# Altium project Project Nixie (Baseboard).PrjPcb
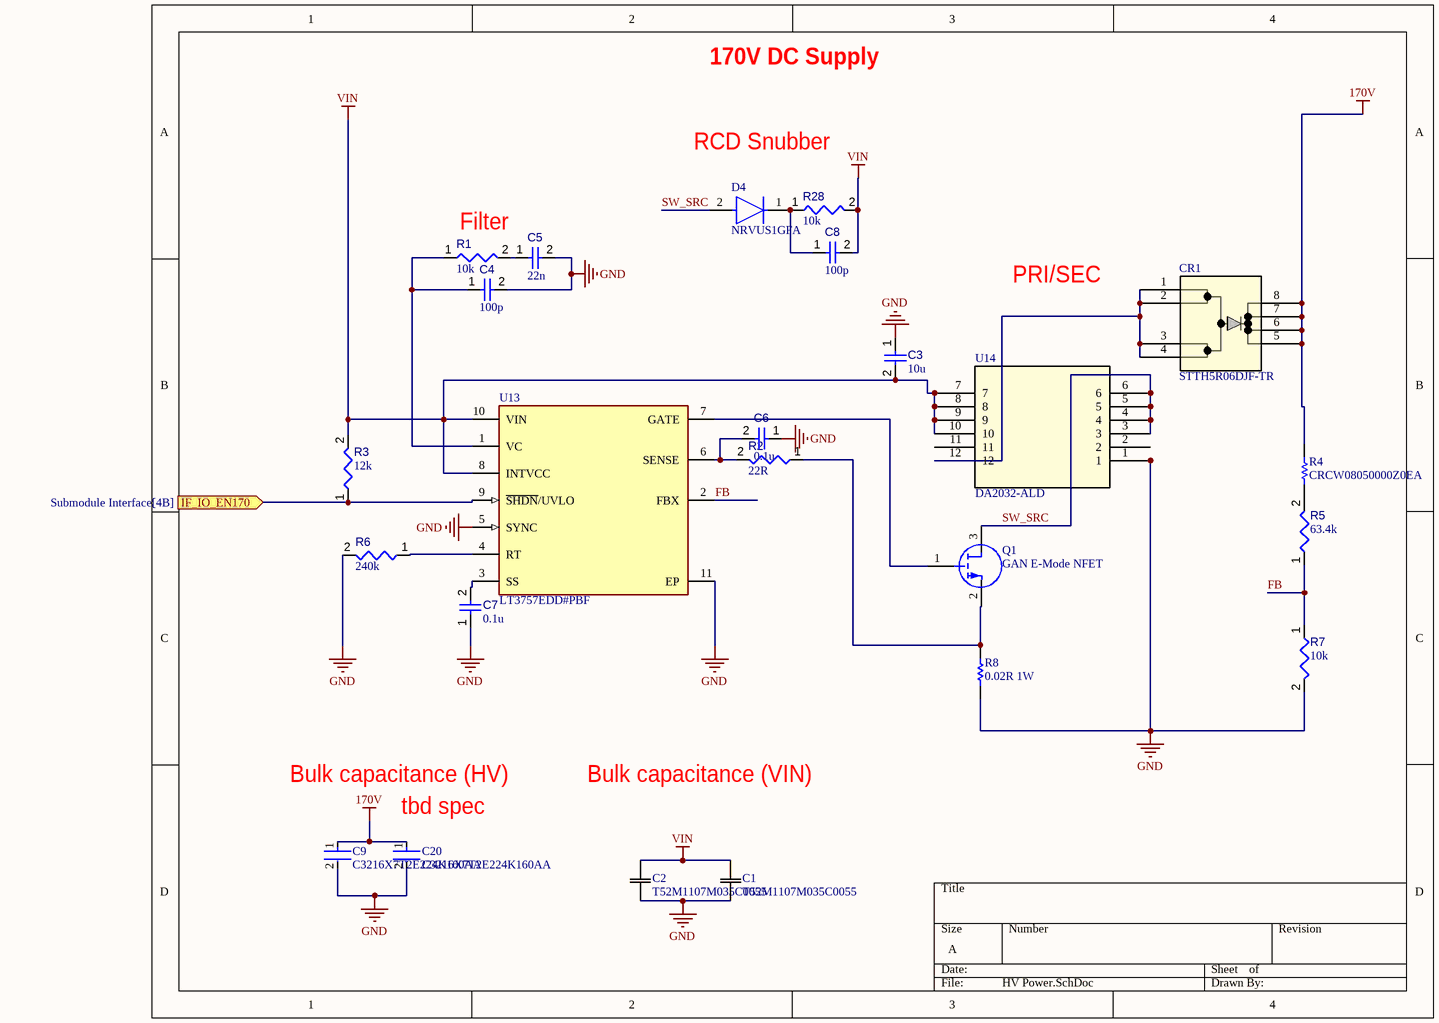
[diagram p0: HV Power.SchDoc]
5 sheets, 91 parts. Net scope: flat (ports and power ports of the same name join across sheets).
Board file: PCB1.PcbDoc
Sheets:
  HV Power.SchDoc
  Drivers.SchDoc
  USB PD.SchDoc
  Digital Supply.SchDoc
  ARGB LEDs.SchDoc

## Sheet HV Power.SchDoc
size A; SheetNumber: 1; SheetTotal: 6

### Parts
C1  T52M1107M035C0055  [CAP_35C0055_VIS]
C2  T52M1107M035C0055  [CAP_35C0055_VIS]
C3  value 10u  [CAPC0402(1005)60_L]  (hidden comment: Capacitor 10µF +/-40% 6.3V 0402)
C4  value 100p  [CAPC0402(1005)60_L]  (hidden comment: Capacitor 10µF +/-40% 6.3V 0402)
C5  value 22n  [CAPC0402(1005)60_L]  (hidden comment: Capacitor 10µF +/-40% 6.3V 0402)
C6  value 0.1u  [CAPC0402(1005)60_L]  (hidden comment: Capacitor 10µF +/-40% 6.3V 0402)
C7  value 0.1u  [CAPC0402(1005)60_L]  (hidden comment: Capacitor 10µF +/-40% 6.3V 0402)
C8  value 100p  [CAPC0402(1005)60_L]  (hidden comment: Capacitor 10µF +/-40% 6.3V 0402)
C9  C3216X7T2E224K160AA  [FP-C3216-160-0_2-IPC_C]
C20  C3216X7T2E224K160AA  [FP-C3216-160-0_2-IPC_C]
CR1  STTH5R06DJF-TR  [POWERFLAT5X6_STM]
D4  NRVUS1GFA  [FP-425AB-MFG]
Q1  GAN E-Mode NFET  [PCBComponent_1]
R1  value 10k  [RESC1005X40X25ML05T05]  (hidden comment: Resistor 10k +/-1% 0402 63 mW)
R2  value 22R  [RESC1005X40X25ML05T05]  (hidden comment: Resistor 10k +/-1% 0402 63 mW)
R3  value 12k  [RESC1005X40X25ML05T05]  (hidden comment: Resistor 10k +/-1% 0402 63 mW)
R4  CRCW08050000Z0EA  [RESC2013X50X30LL20T20]
R5  value 63.4k  [RESC1005X40X25ML05T05]  (hidden comment: Resistor 10k +/-1% 0402 63 mW)
R6  value 240k  [RESC1005X40X25ML05T05]  (hidden comment: Resistor 10k +/-1% 0402 63 mW)
R7  value 10k  [RESC1005X40X25ML05T05]  (hidden comment: Resistor 10k +/-1% 0402 63 mW)
R8  0.02R 1W  [RESC3225X70X50NL20T20]
R28  value 10k  [RESC1005X40X25ML05T05]  (hidden comment: Resistor 10k +/-1% 0402 63 mW)
U13  LT3757EDD#PBF  [FP-DD-10-05-08-1699-IPC_A]
U14  DA2032-ALD  [SOIC12_LT3750_DA2032_14P98X17P2_COC]

### Ports
IF_IO_EN170 (in, see Submodule Interface[4B])

### Nets
170V: C9.1 C20.1 CR1.5 CR1.6 CR1.7 CR1.8 R4.2
GND: C1.1 C2.1 C3.1 C4.2 C5.2 C6.1 C7.1 C9.2 C20.2 R6.2 R7.2 R8.1 U13.5(SYNC) U13.11(EP) U14.1
VIN: C1.2 C2.2 C3.2 C8.2 R3.2 R28.2 U13.8(INTVCC) U13.10(VIN) U14.7 U14.8 U14.9 U14.10
FB: R5.1 R7.1 U13.2(FBX)
SW_SRC: D4.2(A) Q1.3(D) U14.3 U14.4 U14.5 U14.6
NetC4_1: C4.1 R1.1 U13.1(VC)
NetC5_1: C5.1 R1.2
NetC6_2: C6.2 R2.2 U13.6(SENSE)
NetC7_2: C7.2 U13.3(SS)
NetC8_1: C8.1 D4.1(C) R28.1
NetCR1_1: CR1.1 CR1.2 CR1.3 CR1.4 U14.12
NetQ1_1: Q1.1(G) U13.7(GATE)
NetQ1_2: Q1.2(S) R2.1 R8.2
NetR3_1: R3.1 U13.9(~{SHDN}/UVLO) ; port IF_IO_EN170
NetR4_1: R4.1 R5.2
NetR6_1: R6.1 U13.4(RT)

Not connected (* = marked no-connect by the designer): U14 2 11

### Notes on the sheet
- 170V DC Supply
- RCD Snubber
- Filter
- PRI/SEC
- Bulk capacitance (HV)
- (near C20) tbd spec
- Bulk capacitance (VIN)

### Library data of the parts
C1 C2 = T52M1107M035C0055: No Description Available; Mfr_Name: Vishay
C3-C8 = CMP-001-00074-3: Chip Capacitor, 0.1µF +/-40%, 6.3V, 0402, Thickness 0.6 mm; Tolerance: 10%; Case/Package: 0402; Pins: 2; Mounting Technology: SMT; Voltage Rating: 6.3V; Max Operating Temperature: 85°C; Min Operating Temperature: -55°C
C9 C20 = CMP-08246-005598-1: Multilayer Ceramic Capacitors 220nF ±10% 250V X7T SMD 1206; Lead Free: Lead Free; Package Quantity: 1; Capacitance: 220nF; REACH SVHC: No SVHC; Min Operating Temperature: -55°C; Length: 0.126inch; Width: 0.063inch; Mount: Surface Mount; Case Code (Metric): 3216; Voltage Rating: 250V; Tolerance: 10%; Case Code (Imperial): 1206; Depth: 1.6mm; Series: C; Thickness: 0.075inch; RoHS Compliant: Yes; Voltage Rating (DC): 250V; Packaging: Tape and Reel; Max Operating Temperature: 125°C; Dielectric: X7T; Case/Package: 1206
CR1 = STTH5R06DJF-TR: No Description Available; Mfr_Name: STMicroelectronics; RefDes: RefDes; Type: Type
D4 = CMP-00278-106758013-1: NRVUS1GFA Rectifier Diode, 1 Phase, 1 Element, 1A, 400V V(RRM), Silicon; Manufacturer Lifecycle Status: ACTIVE, NOT REC; NexarPartId: 106758013; Lifecycle Status: NRND
Q1 = Component_1
R1-R3 R5-R7 R28 = CMP-009-00019-5: Chip Resistor, 12 KOhm, +/- 1%, 63 mW, -55 to 155 degC, 0402 (1005 Metric); Power: 63mW; Voltage Rating: 50V; Case/Package: 0402; Mounting Technology: SM; Pins: 2; Min Operating Temperature: -55°C; Tolerance: 1%; RoHS Compliant: True; Max Operating Temperature: 155°C
R4 = CMP-2001-04896-1: Manufacturer: Vishay Dale; Part Number: CRCW08050000Z0EA
R8 = CMP-2005-03839-2: Part Number: ERJ-L14KF20MU; Manufacturer: Panasonic
U13 = CMP-09139-000444-1: IC REG CTRLR MULT TOPOLOGY 10DFN; Max Input Voltage: 40V; Number of Output Phases: 1; Min Supply Voltage: 2.9V; Switching Frequency: 1MHz; Min Output Voltage: 1.569V; Max Output Voltage: 350V; Clock Sync: Yes; Output Current: 25A; Topology: Boost; Max Output Current: 12uA; Synchronous Rectifier: No; Height: 0.7mm; Number of Outputs: 1; Packaging: Rail/Tube; Max Supply Voltage: 40V; Min Operating Temperature: -40°C; Output Voltage: 350V; RoHS Compliant: Yes; Mount: Surface Mount; Number of Pins: 10; REACH SVHC: No SVHC; Width: 3mm; Case/Package: DFN; Min Input Voltage: 2.9V; Package Quantity: 121; Length: 3mm; Max Operating Temperature: 125°C
U14 = DA2032-ALD: No Description Available; Mfr_Name: Coilcraft; RefDes: RefDes; Type: Type

## Sheet Drivers.SchDoc
size D; SheetNumber: 2; SheetTotal: 6
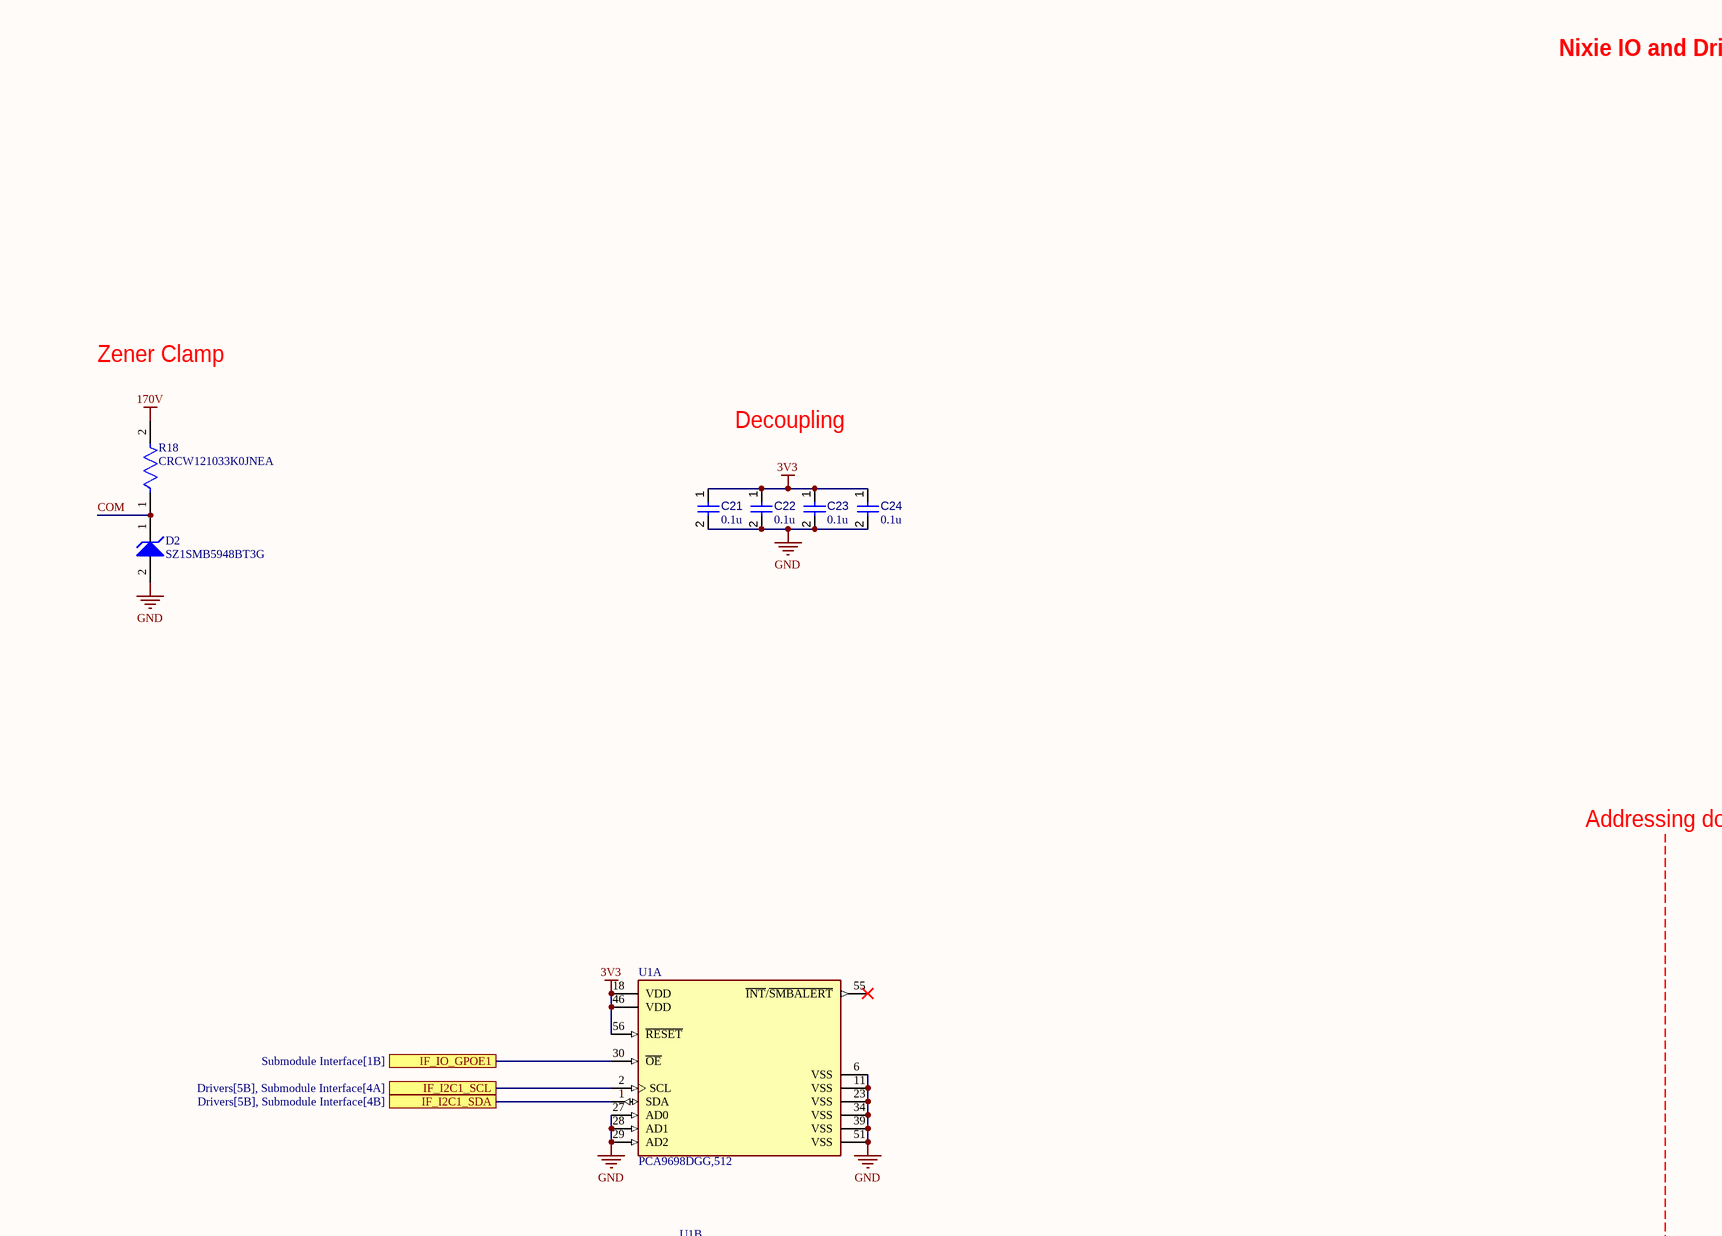
[diagram p1: Drivers.SchDoc, top left]
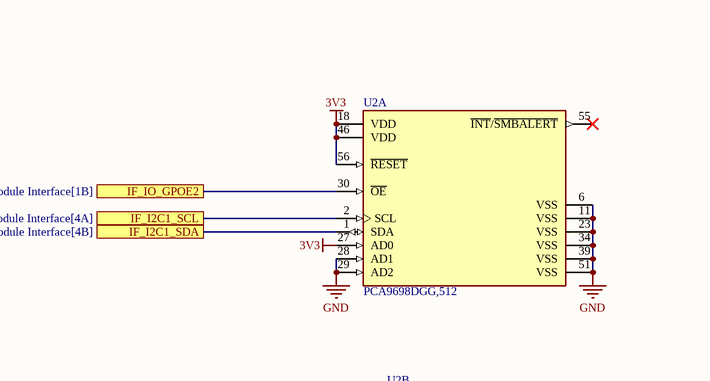
[diagram p2: Drivers.SchDoc, top right]
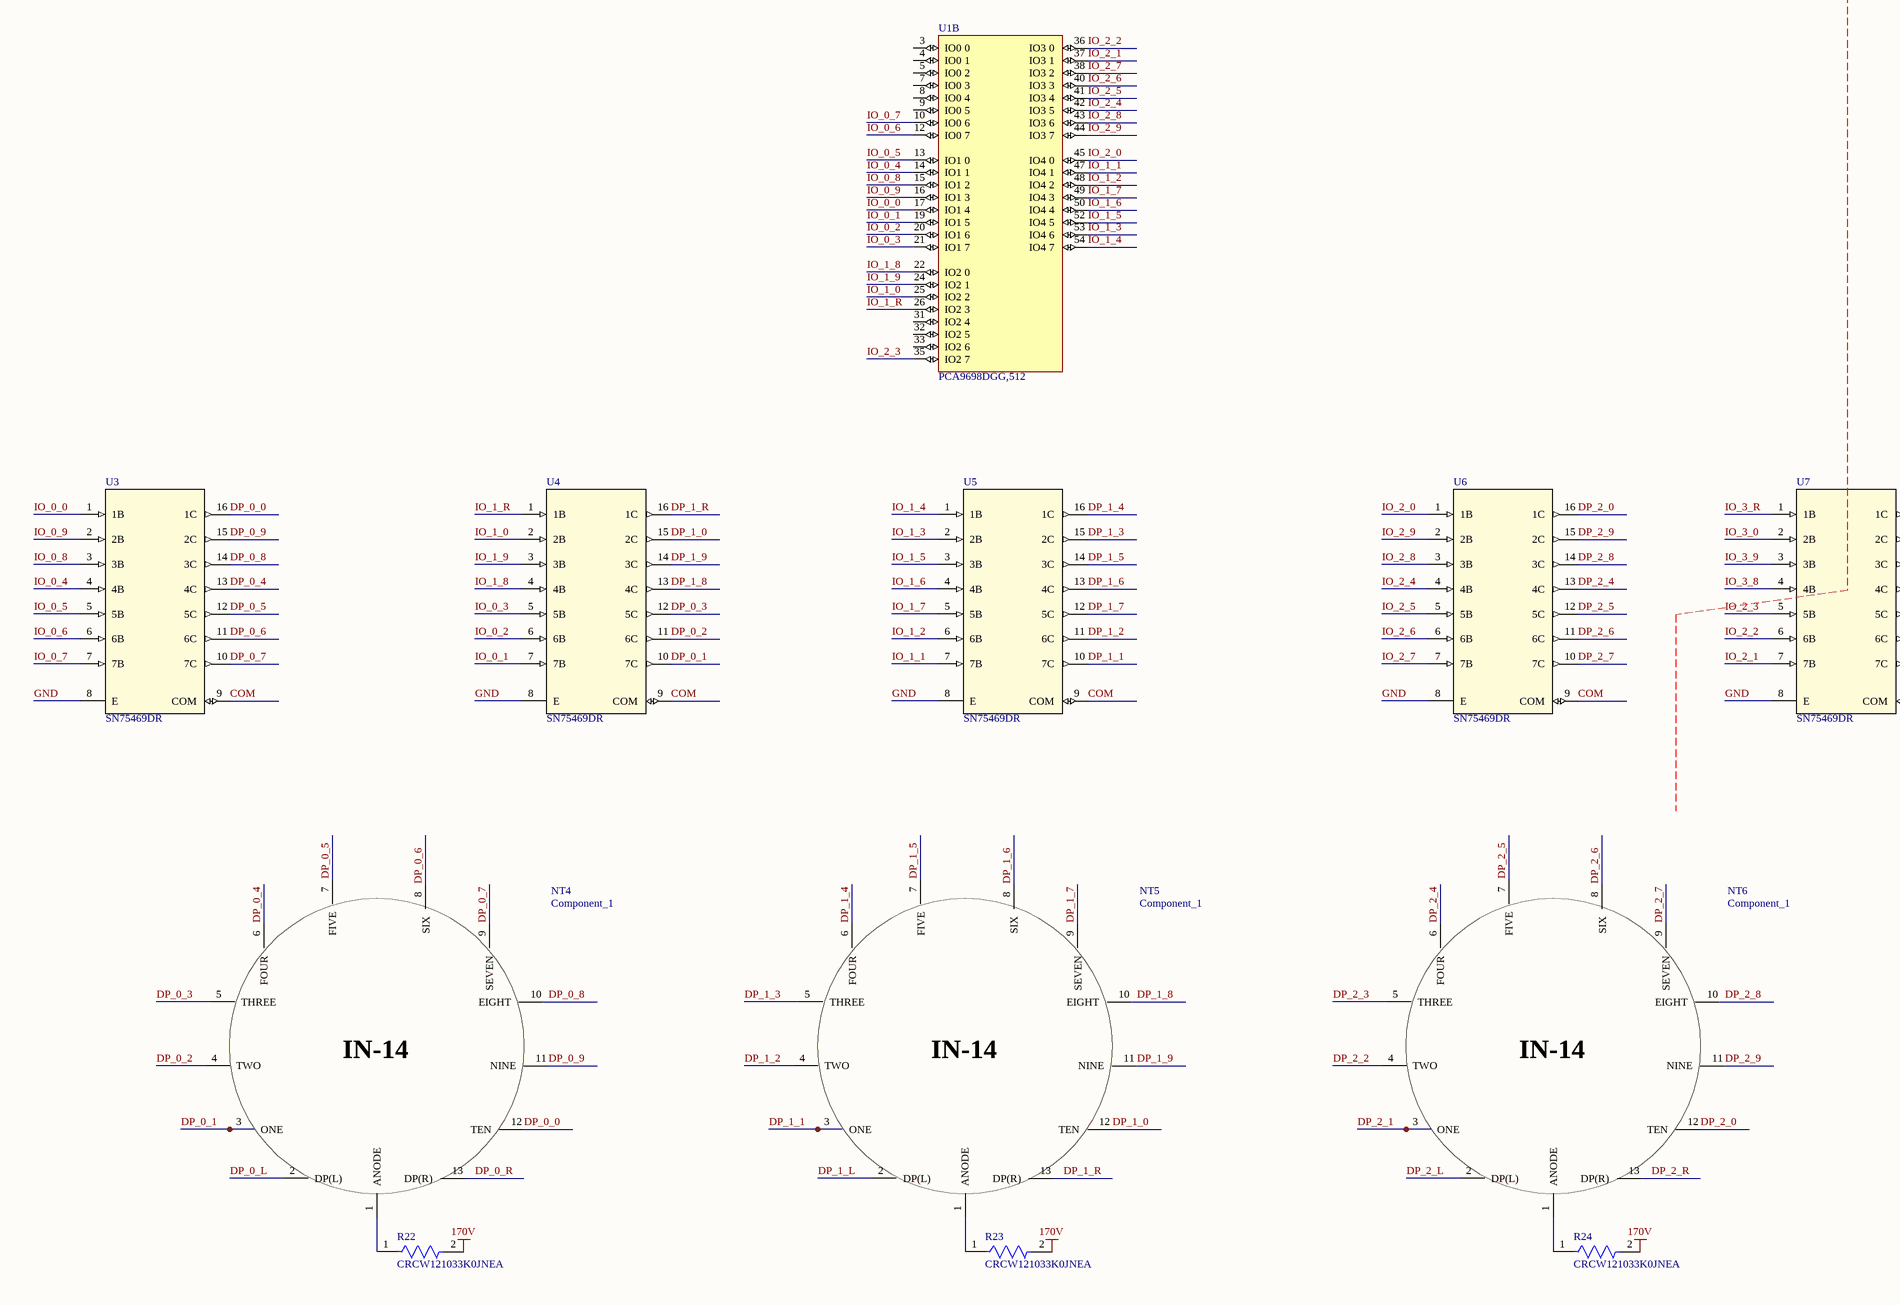
[diagram p3: Drivers.SchDoc, bottom left]
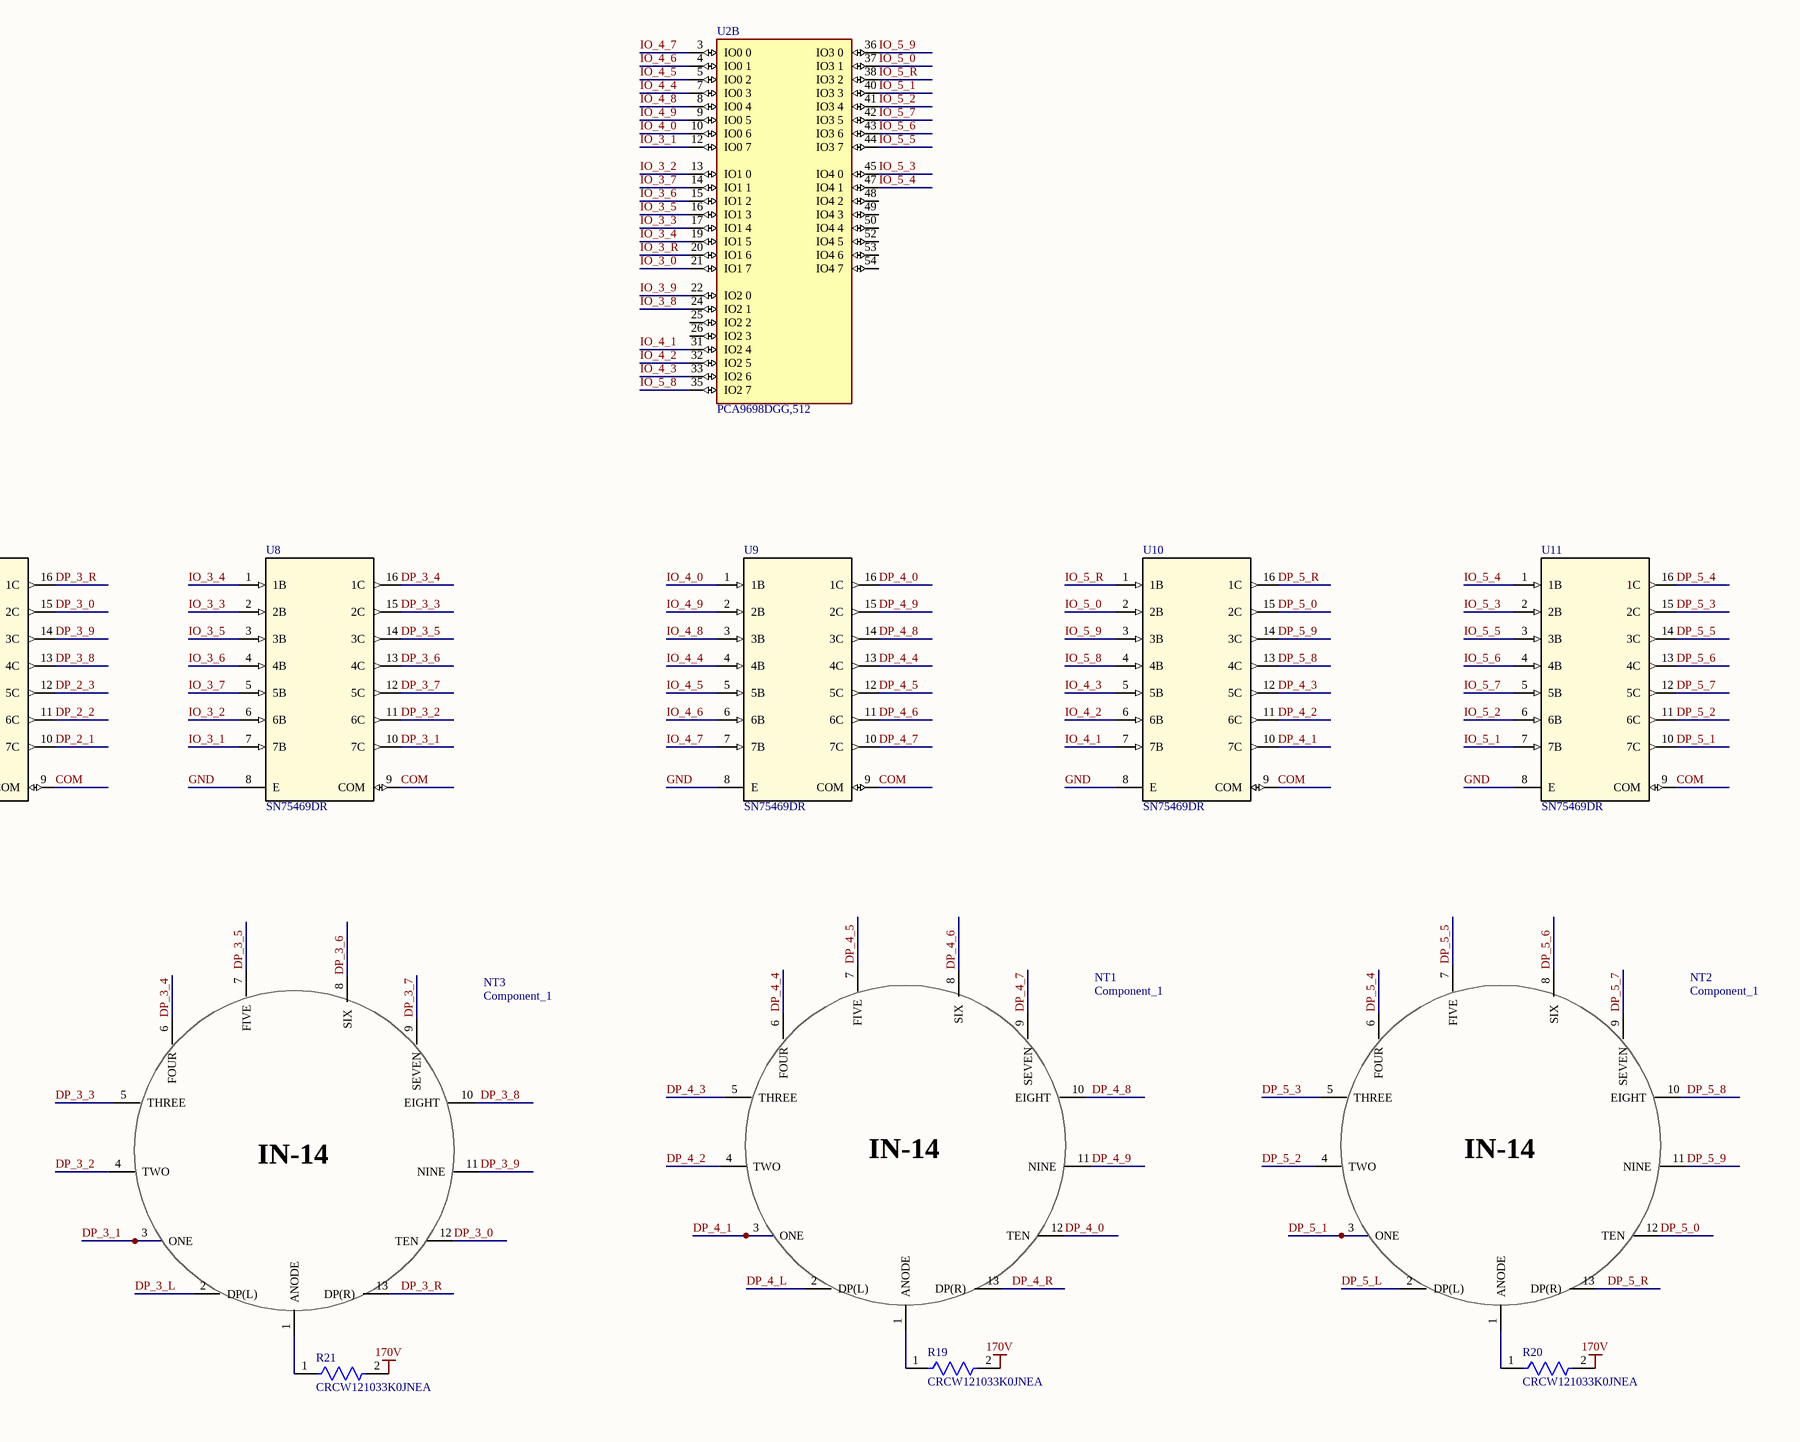
[diagram p4: Drivers.SchDoc, bottom right]

### Parts
C21  value 0.1u  [CAPC0402(1005)60_L]  (hidden comment: Capacitor 10µF +/-40% 6.3V 0402)
C22  value 0.1u  [CAPC0402(1005)60_L]  (hidden comment: Capacitor 10µF +/-40% 6.3V 0402)
C23  value 0.1u  [CAPC0402(1005)60_L]  (hidden comment: Capacitor 10µF +/-40% 6.3V 0402)
C24  value 0.1u  [CAPC0402(1005)60_L]  (hidden comment: Capacitor 10µF +/-40% 6.3V 0402)
D2  SZ1SMB5948BT3G  [ONSC-SMB-2-403A-03_H_V]
NT1  Component_1  [PCBComponent_1]
NT2  Component_1  [PCBComponent_1]
NT3  Component_1  [PCBComponent_1]
NT4  Component_1  [PCBComponent_1]
NT5  Component_1  [PCBComponent_1]
NT6  Component_1  [PCBComponent_1]
R18  CRCW121033K0JNEA  [FP-CRCW1210-e3-IPC_A]
R19  CRCW121033K0JNEA  [FP-CRCW1210-e3-IPC_A]
R20  CRCW121033K0JNEA  [FP-CRCW1210-e3-IPC_A]
R21  CRCW121033K0JNEA  [FP-CRCW1210-e3-IPC_A]
R22  CRCW121033K0JNEA  [FP-CRCW1210-e3-IPC_A]
R23  CRCW121033K0JNEA  [FP-CRCW1210-e3-IPC_A]
R24  CRCW121033K0JNEA  [FP-CRCW1210-e3-IPC_A]
U1  PCA9698DGG,512  [FP-SOT364-1-MFG]  (parts A,B of 2)
U2  PCA9698DGG,512  [FP-SOT364-1-MFG]  (parts A,B of 2)
U3  SN75469DR  [D0016A_N]
U4  SN75469DR  [D0016A_N]
U5  SN75469DR  [D0016A_N]
U6  SN75469DR  [D0016A_N]
U7  SN75469DR  [D0016A_N]
U8  SN75469DR  [D0016A_N]
U9  SN75469DR  [D0016A_N]
U10  SN75469DR  [D0016A_N]
U11  SN75469DR  [D0016A_N]

### Ports
IF_I2C1_SCL (see Drivers[2B], Submodule Interface[4A]), IF_I2C1_SCL (see Drivers[5B], Submodule Interface[4A]), IF_I2C1_SDA (see Drivers[2B], Submodule Interface[4B]), IF_I2C1_SDA (see Drivers[5B], Submodule Interface[4B]), IF_IO_GPOE1 (see Submodule Interface[1B]), IF_IO_GPOE2 (see Submodule Interface[1B])

### Nets
3V3: C21.1 C22.1 C23.1 C24.1 U1.18(VDD) U1.46(VDD) U1.56(~{RESET}) U2.18(VDD) U2.27(AD0) U2.46(VDD) U2.56(~{RESET})
170V: R18.2 R19.2 R20.2 R21.2 R22.2 R23.2 R24.2
GND: C21.2 C22.2 C23.2 C24.2 D2.2(A) U1.6(VSS) U1.11(VSS) U1.23(VSS) U1.27(AD0) U1.28(AD1) U1.29(AD2) U1.34(VSS) U1.39(VSS) U1.51(VSS) U2.6(VSS) U2.11(VSS) U2.23(VSS) U2.28(AD1) U2.29(AD2) U2.34(VSS) U2.39(VSS) U2.51(VSS) U3.8(E) U4.8(E) U5.8(E) U6.8(E) U7.8(E) U8.8(E) U9.8(E) U10.8(E) U11.8(E)
COM: D2.1(K) R18.1 U3.9(COM) U4.9(COM) U5.9(COM) U6.9(COM) U7.9(COM) U8.9(COM) U9.9(COM) U10.9(COM) U11.9(COM)
DP_0_0: NT4.12(TEN) U3.16(1C)
DP_0_1: NT4.3(ONE) U4.10(7C)
DP_0_2: NT4.4(TWO) U4.11(6C)
DP_0_3: NT4.5(THREE) U4.12(5C)
DP_0_4: NT4.6(FOUR) U3.13(4C)
DP_0_5: NT4.7(FIVE) U3.12(5C)
DP_0_6: NT4.8(SIX) U3.11(6C)
DP_0_7: NT4.9(SEVEN) U3.10(7C)
DP_0_8: NT4.10(EIGHT) U3.14(3C)
DP_0_9: NT4.11(NINE) U3.15(2C)
DP_0_L: NT4.2(DP(L))
DP_0_R: NT4.13(DP(R))
DP_1_0: NT5.12(TEN) U4.15(2C)
DP_1_1: NT5.3(ONE) U5.10(7C)
DP_1_2: NT5.4(TWO) U5.11(6C)
DP_1_3: NT5.5(THREE) U5.15(2C)
DP_1_4: NT5.6(FOUR) U5.16(1C)
DP_1_5: NT5.7(FIVE) U5.14(3C)
DP_1_6: NT5.8(SIX) U5.13(4C)
DP_1_7: NT5.9(SEVEN) U5.12(5C)
DP_1_8: NT5.10(EIGHT) U4.13(4C)
DP_1_9: NT5.11(NINE) U4.14(3C)
DP_1_L: NT5.2(DP(L))
DP_1_R: NT5.13(DP(R)) U4.16(1C)
DP_2_0: NT6.12(TEN) U6.16(1C)
DP_2_1: NT6.3(ONE) U7.10(7C)
DP_2_2: NT6.4(TWO) U7.11(6C)
DP_2_3: NT6.5(THREE) U7.12(5C)
DP_2_4: NT6.6(FOUR) U6.13(4C)
DP_2_5: NT6.7(FIVE) U6.12(5C)
DP_2_6: NT6.8(SIX) U6.11(6C)
DP_2_7: NT6.9(SEVEN) U6.10(7C)
DP_2_8: NT6.10(EIGHT) U6.14(3C)
DP_2_9: NT6.11(NINE) U6.15(2C)
DP_2_L: NT6.2(DP(L))
DP_2_R: NT6.13(DP(R))
DP_3_0: NT3.12(TEN) U7.15(2C)
DP_3_1: NT3.3(ONE) U8.10(7C)
DP_3_2: NT3.4(TWO) U8.11(6C)
DP_3_3: NT3.5(THREE) U8.15(2C)
DP_3_4: NT3.6(FOUR) U8.16(1C)
DP_3_5: NT3.7(FIVE) U8.14(3C)
DP_3_6: NT3.8(SIX) U8.13(4C)
DP_3_7: NT3.9(SEVEN) U8.12(5C)
DP_3_8: NT3.10(EIGHT) U7.13(4C)
DP_3_9: NT3.11(NINE) U7.14(3C)
DP_3_L: NT3.2(DP(L))
DP_3_R: NT3.13(DP(R)) U7.16(1C)
DP_4_0: NT1.12(TEN) U9.16(1C)
DP_4_1: NT1.3(ONE) U10.10(7C)
DP_4_2: NT1.4(TWO) U10.11(6C)
DP_4_3: NT1.5(THREE) U10.12(5C)
DP_4_4: NT1.6(FOUR) U9.13(4C)
DP_4_5: NT1.7(FIVE) U9.12(5C)
DP_4_6: NT1.8(SIX) U9.11(6C)
DP_4_7: NT1.9(SEVEN) U9.10(7C)
DP_4_8: NT1.10(EIGHT) U9.14(3C)
DP_4_9: NT1.11(NINE) U9.15(2C)
DP_4_L: NT1.2(DP(L))
DP_4_R: NT1.13(DP(R))
DP_5_0: NT2.12(TEN) U10.15(2C)
DP_5_1: NT2.3(ONE) U11.10(7C)
DP_5_2: NT2.4(TWO) U11.11(6C)
DP_5_3: NT2.5(THREE) U11.15(2C)
DP_5_4: NT2.6(FOUR) U11.16(1C)
DP_5_5: NT2.7(FIVE) U11.14(3C)
DP_5_6: NT2.8(SIX) U11.13(4C)
DP_5_7: NT2.9(SEVEN) U11.12(5C)
DP_5_8: NT2.10(EIGHT) U10.13(4C)
DP_5_9: NT2.11(NINE) U10.14(3C)
DP_5_L: NT2.2(DP(L))
DP_5_R: NT2.13(DP(R)) U10.16(1C)
IO_0_0: U1.17(IO1_4) U3.1(1B)
IO_0_1: U1.19(IO1_5) U4.7(7B)
IO_0_2: U1.20(IO1_6) U4.6(6B)
IO_0_3: U1.21(IO1_7) U4.5(5B)
IO_0_4: U1.14(IO1_1) U3.4(4B)
IO_0_5: U1.13(IO1_0) U3.5(5B)
IO_0_6: U1.12(IO0_7) U3.6(6B)
IO_0_7: U1.10(IO0_6) U3.7(7B)
IO_0_8: U1.15(IO1_2) U3.3(3B)
IO_0_9: U1.16(IO1_3) U3.2(2B)
IO_1_0: U1.25(IO2_2) U4.2(2B)
IO_1_1: U1.47(IO4_1) U5.7(7B)
IO_1_2: U1.48(IO4_2) U5.6(6B)
IO_1_3: U1.53(IO4_6) U5.2(2B)
IO_1_4: U1.54(IO4_7) U5.1(1B)
IO_1_5: U1.52(IO4_5) U5.3(3B)
IO_1_6: U1.50(IO4_4) U5.4(4B)
IO_1_7: U1.49(IO4_3) U5.5(5B)
IO_1_8: U1.22(IO2_0) U4.4(4B)
IO_1_9: U1.24(IO2_1) U4.3(3B)
IO_1_R: U1.26(IO2_3) U4.1(1B)
IO_2_0: U1.45(IO4_0) U6.1(1B)
IO_2_1: U1.37(IO3_1) U7.7(7B)
IO_2_2: U1.36(IO3_0) U7.6(6B)
IO_2_3: U1.35(IO2_7) U7.5(5B)
IO_2_4: U1.42(IO3_5) U6.4(4B)
IO_2_5: U1.41(IO3_4) U6.5(5B)
IO_2_6: U1.40(IO3_3) U6.6(6B)
IO_2_7: U1.38(IO3_2) U6.7(7B)
IO_2_8: U1.43(IO3_6) U6.3(3B)
IO_2_9: U1.44(IO3_7) U6.2(2B)
IO_3_0: U2.21(IO1_7) U7.2(2B)
IO_3_1: U2.12(IO0_7) U8.7(7B)
IO_3_2: U2.13(IO1_0) U8.6(6B)
IO_3_3: U2.17(IO1_4) U8.2(2B)
IO_3_4: U2.19(IO1_5) U8.1(1B)
IO_3_5: U2.16(IO1_3) U8.3(3B)
IO_3_6: U2.15(IO1_2) U8.4(4B)
IO_3_7: U2.14(IO1_1) U8.5(5B)
IO_3_8: U2.24(IO2_1) U7.4(4B)
IO_3_9: U2.22(IO2_0) U7.3(3B)
IO_3_R: U2.20(IO1_6) U7.1(1B)
IO_4_0: U2.10(IO0_6) U9.1(1B)
IO_4_1: U2.31(IO2_4) U10.7(7B)
IO_4_2: U2.32(IO2_5) U10.6(6B)
IO_4_3: U2.33(IO2_6) U10.5(5B)
IO_4_4: U2.7(IO0_3) U9.4(4B)
IO_4_5: U2.5(IO0_2) U9.5(5B)
IO_4_6: U2.4(IO0_1) U9.6(6B)
IO_4_7: U2.3(IO0_0) U9.7(7B)
IO_4_8: U2.8(IO0_4) U9.3(3B)
IO_4_9: U2.9(IO0_5) U9.2(2B)
IO_5_0: U2.37(IO3_1) U10.2(2B)
IO_5_1: U2.40(IO3_3) U11.7(7B)
IO_5_2: U2.41(IO3_4) U11.6(6B)
IO_5_3: U2.45(IO4_0) U11.2(2B)
IO_5_4: U2.47(IO4_1) U11.1(1B)
IO_5_5: U2.44(IO3_7) U11.3(3B)
IO_5_6: U2.43(IO3_6) U11.4(4B)
IO_5_7: U2.42(IO3_5) U11.5(5B)
IO_5_8: U2.35(IO2_7) U10.4(4B)
IO_5_9: U2.36(IO3_0) U10.3(3B)
IO_5_R: U2.38(IO3_2) U10.1(1B)
NetNT1_1: NT1.1(ANODE) R19.1
NetNT2_1: NT2.1(ANODE) R20.1
NetNT3_1: NT3.1(ANODE) R21.1
NetNT4_1: NT4.1(ANODE) R22.1
NetNT5_1: NT5.1(ANODE) R23.1
NetNT6_1: NT6.1(ANODE) R24.1
NetU1_1: U1.1(SDA) U2.1(SDA) ; port IF_I2C1_SDA
NetU1_2: U1.2(SCL) U2.2(SCL) ; port IF_I2C1_SCL
NetU1_30: U1.30(~{OE}) ; port IF_IO_GPOE1
NetU2_30: U2.30(~{OE}) ; port IF_IO_GPOE2

Not connected (* = marked no-connect by the designer): U1 3(IO0_0) 4(IO0_1) 5(IO0_2) 7(IO0_3) 8(IO0_4) 9(IO0_5) 31(IO2_4) 32(IO2_5) 33(IO2_6) 55(~{INT}/~{SMBALERT})*; U2 25(IO2_2) 26(IO2_3) 48(IO4_2) 49(IO4_3) 50(IO4_4) 52(IO4_5) 53(IO4_6) 54(IO4_7) 55(~{INT}/~{SMBALERT})*

### Notes on the sheet
- Nixie IO and Drivers
- Zener Clamp
- Decoupling
- Addressing domain
- (in symbol Component_1) IN-14

### Library data of the parts
C21-C24 = CMP-001-00074-3: as C3 on sheet HV Power; Case/Package: 0402; Pins: 2; Mounting Technology: SMT; Voltage Rating: 6.3V; Max Operating Temperature: 85°C; Min Operating Temperature: -55°C
D2 = CMP-1060-00202-1: 3 W Zener Voltage Regulator, 2-Pin SMB, Pb-Free, Tape and Reel; Manufacturer: On Semiconductor; VZ Typ (V): 91; Mounting Technology: Surface Mount; ComponentLink3URL: http://www.onsemi.com/pub_link/Collateral/1SMB5913BT3-D.PDF; RoHS: Pb-Free; ComponentLink2URL: http://www.onsemi.cn/pub_link/Collateral/1SMB5913BT3-D.PDF; ComponentLink2Description: Datasheet; ComponentLink1URL: http://www.onsemi.com/; PackageDescription: 2-Pin Small Molded Package, J-Bend Lead, Body 4.33 x 3.625 mm; PartNumber: SZ1SMB5948BT3G; ComponentLink3Description: Package Specification; Packing: Tape and Reel; ComponentLink1Description: Manufacturer URL; PackageVersion: Rev. H, 05/2011; DatasheetVersion: Rev. 8; PackageReference: SMB-2-403A-03_H
R18-R24 = CMP-1015-00110-3: RES SMD 205K OHM 1% 1/2W 2008; Voltage Rating: 200V; Tolerance: 5%; Temperature Coefficient: 200ppm/°C; Power Rating: 500mW; Resistance: 33kR; Weight: 0.000564oz; Length: 3.2mm; Lead Free: Lead Free; Min Operating Temperature: -55°C; Packaging: Tape and Reel; Mount: Surface Mount; Contact Plating: Tin; Case Code (Metric): 3225; Radiation Hardening: No; Case Code (Imperial): 1210; Case/Package: 1210; Composition: Thick Film; Voltage Rating (DC): 200V; Package Quantity: 5000; Height: 0.55mm; Max Operating Temperature: 155°C; Width: 2.5mm; Termination: SMD/SMT
U1 U2 = CMP-10112-000033-1: IC I/O EXPANDER I2C 40B 56TSSOP; Max Supply Voltage: 5.5V; Max Frequency: 1MHz; Output Current: 50mA; Nominal Supply Current: 100mA; Min Supply Voltage: 2.3V; Number of I/Os: 40; Max Power Dissipation: 500mW; Case/Package: TSSOP; Packaging: Rail/Tube; Package Quantity: 35; Interface: I2C; Frequency: 1MHz; Series: -; Supply Voltage-Nom: 5.5V; Min Operating Temperature: -40°C; Mount: Surface Mount; Weight: 0.026103oz; Supply Current: 100mA; Radiation Hardening: No; Number of Pins: 56; Max Operating Temperature: 85°C; Lead Free: Lead Free
U3-U11 = SN75469DR: No Description Available; Mfr_Name: Texas Instruments; TYPE: TYPE; RefDes: RefDes

## Sheet USB PD.SchDoc
size A; SheetNumber: 3; SheetTotal: 6
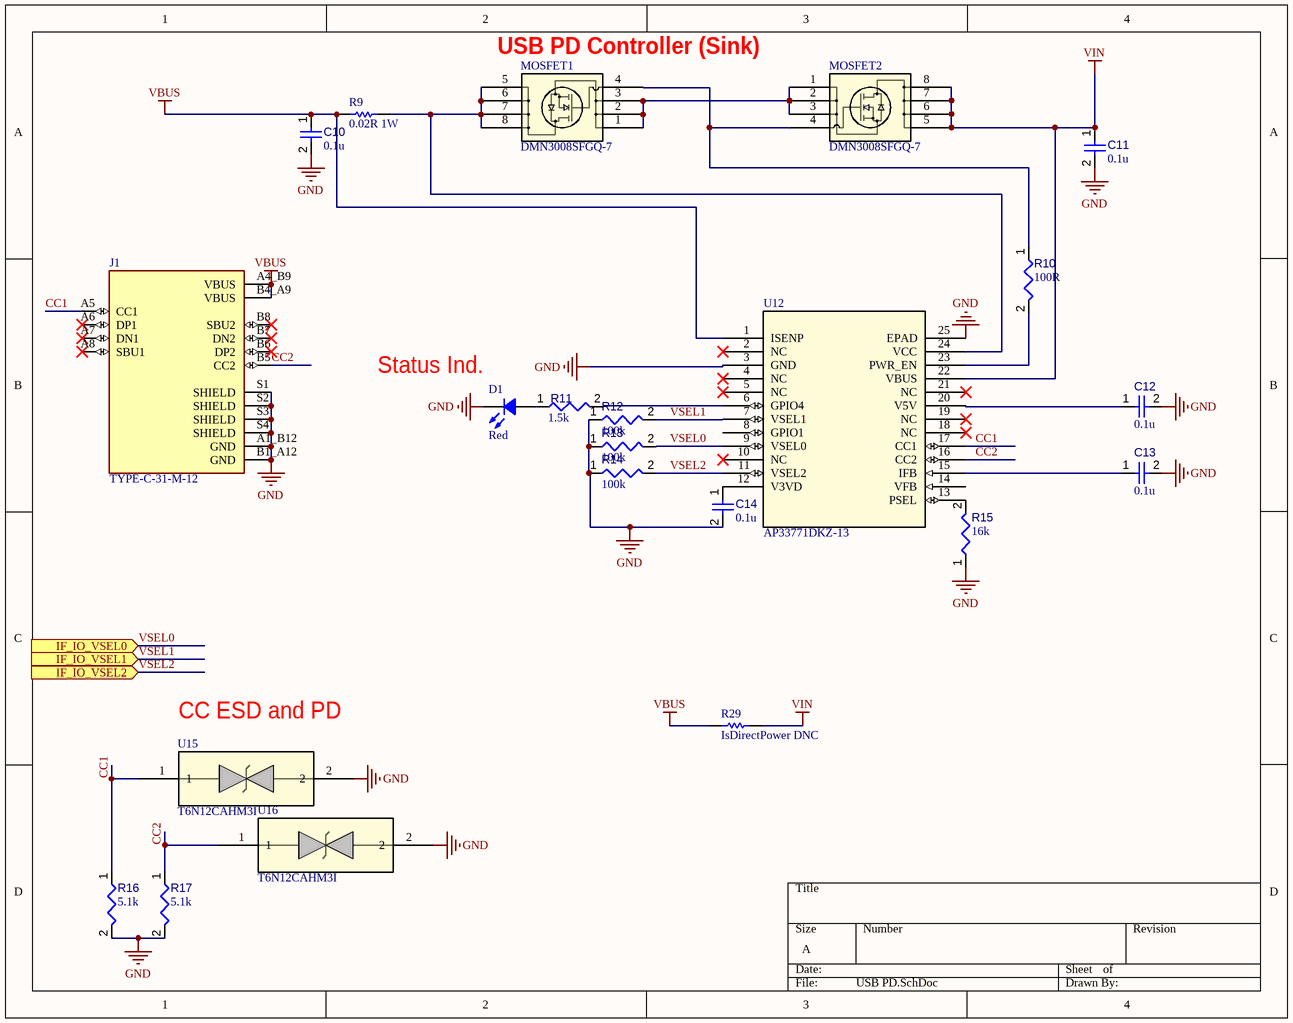
[diagram p5: USB PD.SchDoc]

### Parts
C10  value 0.1u  [CAPC0402(1005)60_L]  (hidden comment: Capacitor 10µF +/-40% 6.3V 0402)
C11  value 0.1u  [CAPC0402(1005)60_L]  (hidden comment: Capacitor 10µF +/-40% 6.3V 0402)
C12  value 0.1u  [CAPC0402(1005)60_L]  (hidden comment: Capacitor 10µF +/-40% 6.3V 0402)
C13  value 0.1u  [CAPC0402(1005)60_L]  (hidden comment: Capacitor 10µF +/-40% 6.3V 0402)
C14  value 0.1u  [CAPC0402(1005)60_L]  (hidden comment: Capacitor 10µF +/-40% 6.3V 0402)
D1  Red  [LED 0402_1005 YELLOW]
J1  TYPE-C-31-M-12  [HRO_TYPE-C-31-M-12]
MOSFET1  DMN3008SFGQ-7  [PowerDI3333-8_DIO]
MOSFET2  DMN3008SFGQ-7  [PowerDI3333-8_DIO]
R9  0.02R 1W  [RESC3225X70X50NL20T20]
R10  value 100R  [RESC1005X40X25ML05T05]  (hidden comment: Resistor 10k +/-1% 0402 63 mW)
R11  value 1.5k  [RESC1005X40X25ML05T05]  (hidden comment: Resistor 10k +/-1% 0402 63 mW)
R12  value 100k  [RESC1005X40X25ML05T05]  (hidden comment: Resistor 10k +/-1% 0402 63 mW)
R13  value 100k  [RESC1005X40X25ML05T05]  (hidden comment: Resistor 10k +/-1% 0402 63 mW)
R14  value 100k  [RESC1005X40X25ML05T05]  (hidden comment: Resistor 10k +/-1% 0402 63 mW)
R15  value 16k  [RESC1005X40X25ML05T05]  (hidden comment: Resistor 10k +/-1% 0402 63 mW)
R16  value 5.1k  [RESC1005X40X25ML05T05]  (hidden comment: Resistor 10k +/-1% 0402 63 mW)
R17  value 5.1k  [RESC1005X40X25ML05T05]  (hidden comment: Resistor 10k +/-1% 0402 63 mW)
R29  IsDirectPower DNC  [RESC3225X70X50NL20T20]
U12  AP33771DKZ-13  [QFN24_W-QFN4040-24_A1_DIO]
U15  T6N12CAHM3I  [DFN3820A-2_VIS]
U16  T6N12CAHM3I  [DFN3820A-2_VIS]

### Ports
IF_IO_VSEL0 (in), IF_IO_VSEL1 (in), IF_IO_VSEL2 (in)

### Nets
GND: C10.2 C11.2 C12.2 C13.2 C14.2 D1.2 J1.A1_B12(GND) J1.B1_A12(GND) J1.S1(SHIELD) J1.S2(SHIELD) J1.S3(SHIELD) J1.S4(SHIELD) R12.1 R13.1 R14.1 R15.1 R16.2 R17.2 U12.3(GND) U12.25(EPAD) U15.2 U16.2
VBUS: C10.1 J1.A4_B9(VBUS) J1.B4_A9(VBUS) R9.2 R29.2 U12.1(ISENP)
VIN: C11.1 MOSFET2.5 MOSFET2.6 MOSFET2.7 MOSFET2.8 R29.1 U12.22(VBUS)
CC1: J1.A5(CC1) R16.1 U12.17(CC1) U15.1
CC2: J1.B5(CC2) R17.1 U12.16(CC2) U16.1
VSEL0: R13.2 U12.9(VSEL0) ; port IF_IO_VSEL0
VSEL1: R12.2 U12.7(VSEL1) ; port IF_IO_VSEL1
VSEL2: R14.2 U12.11(VSEL2) ; port IF_IO_VSEL2
NetC12_1: C12.1 U12.20(V5V)
NetC13_1: C13.1 U12.15(IFB)
NetC14_1: C14.1 U12.12(V3VD)
NetD1_1: D1.1 R11.1
NetMOSFET1_1: MOSFET1.1 MOSFET1.2 MOSFET1.3 MOSFET2.1 MOSFET2.2 MOSFET2.3
NetMOSFET1_4: MOSFET1.4 MOSFET2.4 R10.1
NetMOSFET1_5: MOSFET1.5 MOSFET1.6 MOSFET1.7 MOSFET1.8 R9.1 U12.24(VCC)
NetR10_2: R10.2 U12.23(PWR_EN)
NetR11_2: R11.2 U12.6(GPIO4)
NetR15_2: R15.2 U12.13(PSEL)

Not connected (* = marked no-connect by the designer): J1 A6(DP1)* A7(DN1)* A8(SBU1)* B6(DP2)* B7(DN2)* B8(SBU2)*; U12 2(NC)* 4(NC)* 5(NC)* 8(GPIO1) 10(NC)* 14(VFB) 18(NC)* 19(NC)* 21(NC)*

### Notes on the sheet
- (near MOSFET1) USB PD Controller (Sink)
- (near D1) Status Ind.
- (near U15) CC ESD and PD

### Library data of the parts
C10-C14 = CMP-001-00074-3: as C3 on sheet HV Power; Case/Package: 0402; Pins: 2; Mounting Technology: SMT; Voltage Rating: 6.3V; Max Operating Temperature: 85°C; Min Operating Temperature: -55°C
D1 = BL-HKC37A-AV-TRB: 0402 RED; Manufacturer: American Bright Optoelectronics Corporation; Color: Yellow; Configuration: Standard; Current - Test: 20mA; Lens Color: Colorless; Lens Style: Rectangle with Flat Top; Lens Transparency: Clear; Millicandela Rating: 120mcd; Viewing Angle: 120°; Voltage - Forward (Vf) (Typ): 2.2V; Wavelength - Dominant: 589nm; Wavelength - Peak: 590nm; Part Number: BL-HKC37A-AV-TRB; ComponentLink1Description: Datasheet; ComponentLink1URL: https://americanbrightled.com/pdffiles/smt/BL-HKC37A-AV-TRB.pdf; ComponentLink2Description: DigiKey Link; ComponentLink2URL: https://www.digikey.com/en/products/detail/american-bright-optoelectronics-corporation/BL-HKC37A-AV-TRB/9678171; Device Package: 0402 (1005 Metric); Height (Max): 0.45mm; LastUpdated: 11/9/2022 10:29:51 am; Lifecycle Status: Active; Minimum Order: 1; Mounting Type: Surface Mount; Package / Case: 0402 (1005 Metric); Packaging: TapeAndReel; PartId: 1041; Part Status: Active; Price: 0.06; Series: -; Size / Dimension: 1.00mm L x 0.50mm W; Supplier 1: DigiKey; Supplier Part Number 1: BL-HKC37A-AV-TRBCT-ND; Supplier Device Package: 0402; Value: Red
J1 = TYPE-C-31-M-12: USB Connectors 24 Receptacle 1 8.94*7.3mm RoHS; MF: HRO Electronics Co., Ltd.; SnapEDA_Link: https://www.snapeda.com/parts/TYPE-C-31-M-12/HRO+Electronics+Co.%252C+Ltd./view-part/?ref=snap; Package: Package; Value: *; MP: TYPE-C-31-M-12; Check_prices: https://www.snapeda.com/parts/TYPE-C-31-M-12/HRO+Electronics+Co.%252C+Ltd./view-part/?ref=eda
MOSFET1 MOSFET2 = DMN3008SFGQ-7: No Description Available; Mfr_Name: Diodes Inc; RefDes: RefDes; Type: Type
R9 R29 = CMP-2005-03839-2: as R8 on sheet HV Power
R10 R12-R17 = CMP-009-00019-5: as R1 on sheet HV Power; Case/Package: 0402; Mounting Technology: SM; Pins: 2; Min Operating Temperature: -55°C; Tolerance: 1%; RoHS Compliant: True; Max Operating Temperature: 155°C
R11 = CMP-009-00019-5: Chip Resistor, 1.5 KOhm, +/- 1%, 63 mW, -55 to 155 degC, 0402 (1005 Metric); Power: 63mW; Voltage Rating: 50V; Case/Package: 0402; Mounting Technology: SM; Pins: 2; Min Operating Temperature: -55°C; Tolerance: 1%; RoHS Compliant: True; Max Operating Temperature: 155°C
U12 = AP33771DKZ-13: No Description Available; Mfr_Name: Diodes Inc; RefDes: RefDes; Type: Type
U15 U16 = T6N12CAHM3I: No Description Available; Mfr_Name: Vishay; RefDes: RefDes; Type: Type

## Sheet Digital Supply.SchDoc
size A; SheetNumber: 4; SheetTotal: 6
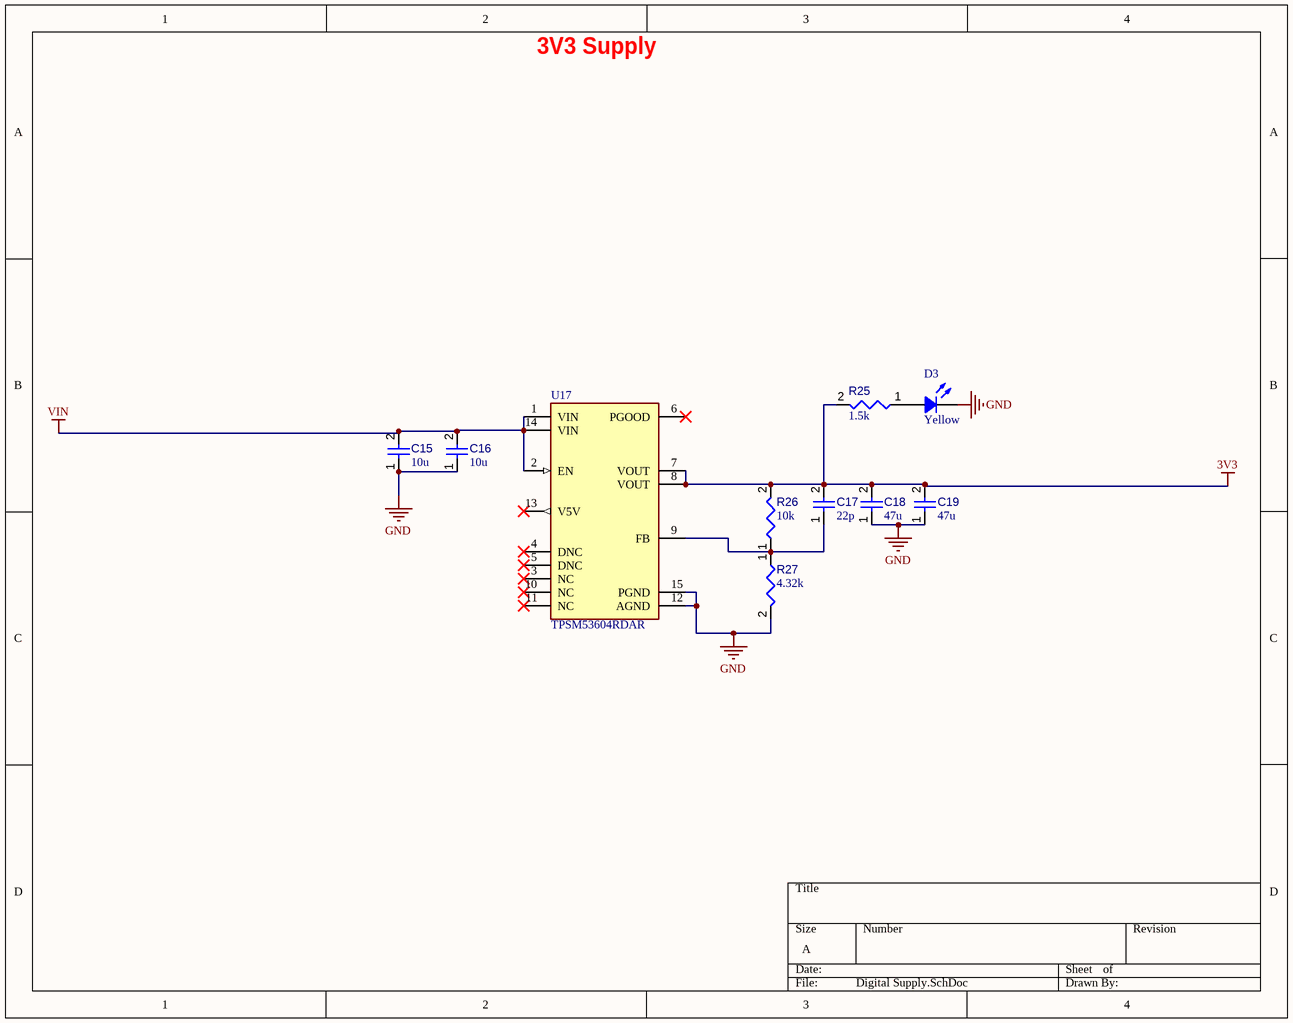
[diagram p6: Digital Supply.SchDoc]

### Parts
C15  value 10u  [CAPC3216X180X50NL20T25]  (hidden comment: Capacitor 10 uF +/- 10% 16 V 1206)
C16  value 10u  [CAPC3216X180X50NL20T25]  (hidden comment: Capacitor 10 uF +/- 10% 16 V 1206)
C17  value 22p  [CAPC0402(1005)60_L]  (hidden comment: Capacitor 22pF +/-10% 50V 0402)
C18  value 47u  [CAPC3216X180X50NL20T25]  (hidden comment: Capacitor 10 uF +/- 10% 16 V 1206)
C19  value 47u  [CAPC3216X180X50NL20T25]  (hidden comment: Capacitor 10 uF +/- 10% 16 V 1206)
D3  Yellow  [LED 0402_1005 YELLOW]
R25  value 1.5k  [RESC1005X40X25ML05T05]  (hidden comment: Resistor 10k +/-1% 0402 63 mW)
R26  value 10k  [RESC1005X40X25ML05T05]  (hidden comment: Resistor 10k +/-1% 0402 63 mW)
R27  value 4.32k  [RESC1005X40X25ML05T05]  (hidden comment: Resistor 10k +/-1% 0402 63 mW)
U17  TPSM53604RDAR  [FP-RDA0015A-MFG]

### Nets
3V3: C17.2 C18.2 C19.2 R25.2 R26.2 U17.7(VOUT) U17.8(VOUT)
GND: C15.1 C16.1 C18.1 C19.1 D3.2 R27.2 U17.12(AGND) U17.15(PGND)
VIN: C15.2 C16.2 U17.1(VIN) U17.2(EN) U17.14(VIN)
NetC17_1: C17.1 R26.1 R27.1 U17.9(FB)
NetD3_1: D3.1 R25.1

Not connected (* = marked no-connect by the designer): U17 3(NC)* 4(DNC)* 5(DNC)* 6(PGOOD)* 10(NC)* 11(NC)* 13(V5V)*

### Notes on the sheet
- 3V3 Supply

### Library data of the parts
C15 C16 C18 C19 = CMP-001-00016-6: Chip Capacitor, 47 uF, +/- 10%, 16 V, 1206 (3216 Metric); Capacitor Type: Ceramic; Voltage Rating: 16V; Tolerance: 10%; Min Operating Temperature: -55°C; Pins: 2; Mounting Technology: SM; Case/Package: 1206; Max Operating Temperature: 125°C; RoHS Compliant: True
C17 = CMP-001-00073-3: Chip Capacitor, 22pF +/-10%, 50V, 0402, Thickness 0.6 mm; Tolerance: 10%; Pins: 2; Voltage Rating: 50V; Max Operating Temperature: 85°C; Min Operating Temperature: -55°C; Mounting Technology: SMT; Case/Package: 0402
D3 = BL-HKC37A-AV-TRB: 0402 YELLOW; Manufacturer: American Bright Optoelectronics Corporation; Configuration: Standard; Current - Test: 20mA; Lens Color: Colorless; Lens Style: Rectangle with Flat Top; Lens Transparency: Clear; Millicandela Rating: 120mcd; Viewing Angle: 120°; Voltage - Forward (Vf) (Typ): 2.2V; Wavelength - Dominant: 589nm; Wavelength - Peak: 590nm; Part Number: BL-HKC37A-AV-TRB; Color: Yellow; ComponentLink1Description: Datasheet; ComponentLink1URL: https://americanbrightled.com/pdffiles/smt/BL-HKC37A-AV-TRB.pdf; ComponentLink2Description: DigiKey Link; ComponentLink2URL: https://www.digikey.com/en/products/detail/american-bright-optoelectronics-corporation/BL-HKC37A-AV-TRB/9678171; Device Package: 0402 (1005 Metric); Height (Max): 0.45mm; LastUpdated: 11/9/2022 10:29:51 am; Lifecycle Status: Active; Minimum Order: 1; Mounting Type: Surface Mount; Package / Case: 0402 (1005 Metric); Packaging: TapeAndReel; PartId: 1041; Part Status: Active; Price: 0.06; Series: -; Size / Dimension: 1.00mm L x 0.50mm W; Supplier 1: DigiKey; Supplier Part Number 1: BL-HKC37A-AV-TRBCT-ND; Supplier Device Package: 0402; Value: Yellow
R25-R27 = CMP-009-00019-5: Chip Resistor, 10 KOhm, +/- 1%, 63 mW, -55 to 155 degC, 0402 (1005 Metric); Power: 63mW; Voltage Rating: 50V; Case/Package: 0402; Mounting Technology: SM; Pins: 2; Min Operating Temperature: -55°C; Tolerance: 1%; RoHS Compliant: True; Max Operating Temperature: 155°C
U17 = CMP-04918-000081-1: DC/DC CONVRTR 36VIN 1V-12VOUT  3; Manufacturer: Texas Instruments; Number Of Outputs: 1; Nominal Supply Current: 24uA; Output Current: 4A; Min Supply Voltage: 3.8V; Switching Topology: Buck-Boost; Output Voltage: 1-7V; Max Supply Voltage: 36V; Output Type: AdjustableProgrammable; Max Duty Cycle: 98%; Switching Frequency: 1.4MHz; Max Junction Temp: +150°C; Temperature Range Low: -40°C; RoHS: TRUE; Device Class L1: Integrated Circuits (ICs); Temperature: -40°C to +125°C; Octopart: https://octopart.com/tpsm53604rdar-texas+instruments-106673079; Ambient Temperature Range High: +105°C; ComponentLink2URL: http://www.ti.com/lit/ds/symlink/tpsm53604.pdf; Digikey Description: DC/DC CONVRTR 36VIN 1V-12VOUT  3; Category: IC; Device Class L2: Power Management ICs; Package: RDA0015A; Manufacturer Part Number: TPSM53604RDAR; ComponentLink2Description: Datasheet; Device Class L3: Voltage Regulators - Switching; Lead Free: Yes; Temperature Range High: +125°C; Ambient Temperature Range Low: -40°C; Automotive: No; Height: 4.1mm

## Sheet ARGB LEDs.SchDoc
size A; SheetNumber: 5; SheetTotal: 6
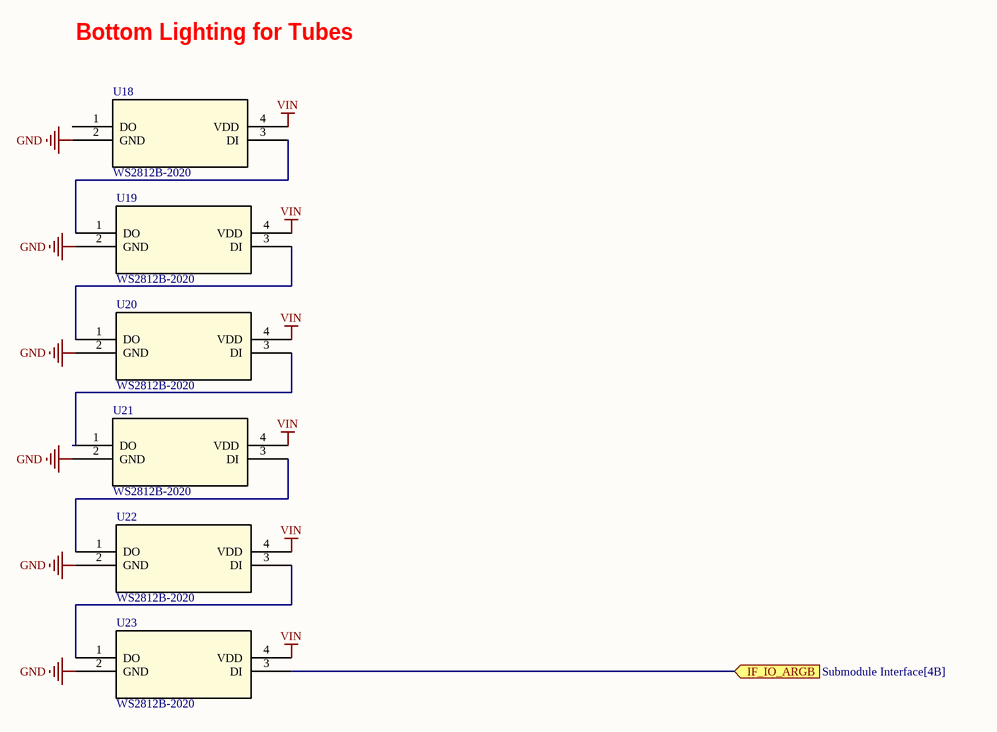
[diagram p7: ARGB LEDs.SchDoc]

### Parts
U18  WS2812B-2020  [SMT_12B-2020_WDS]
U19  WS2812B-2020  [SMT_12B-2020_WDS]
U20  WS2812B-2020  [SMT_12B-2020_WDS]
U21  WS2812B-2020  [SMT_12B-2020_WDS]
U22  WS2812B-2020  [SMT_12B-2020_WDS]
U23  WS2812B-2020  [SMT_12B-2020_WDS]

### Ports
IF_IO_ARGB (in, see Submodule Interface[4B])

### Nets
GND: U18.2(GND) U19.2(GND) U20.2(GND) U21.2(GND) U22.2(GND) U23.2(GND)
VIN: U18.4(VDD) U19.4(VDD) U20.4(VDD) U21.4(VDD) U22.4(VDD) U23.4(VDD)
NetU18_3: U18.3(DI) U19.1(DO)
NetU19_3: U19.3(DI) U20.1(DO)
NetU20_3: U20.3(DI) U21.1(DO)
NetU21_3: U21.3(DI) U22.1(DO)
NetU22_3: U22.3(DI) U23.1(DO)
NetU23_3: U23.3(DI) ; port IF_IO_ARGB

Not connected (* = marked no-connect by the designer): U18 1(DO)

### Notes on the sheet
- Bottom Lighting for Tubes

### Library data of the parts
U18-U23 = WS2812B-2020: No Description Available; Mfr_Name: Worldsemi; RefDes: RefDes; Type: Type

## Nets that join several sheets
3V3: Drivers (11 pins), Digital Supply (7 pins)
170V: HV Power (7 pins), Drivers (7 pins)
GND: HV Power (15 pins), Drivers (31 pins), USB PD (22 pins), Digital Supply (8 pins), ARGB LEDs (6 pins)
VIN: HV Power (12 pins), USB PD (7 pins), Digital Supply (5 pins), ARGB LEDs (6 pins)